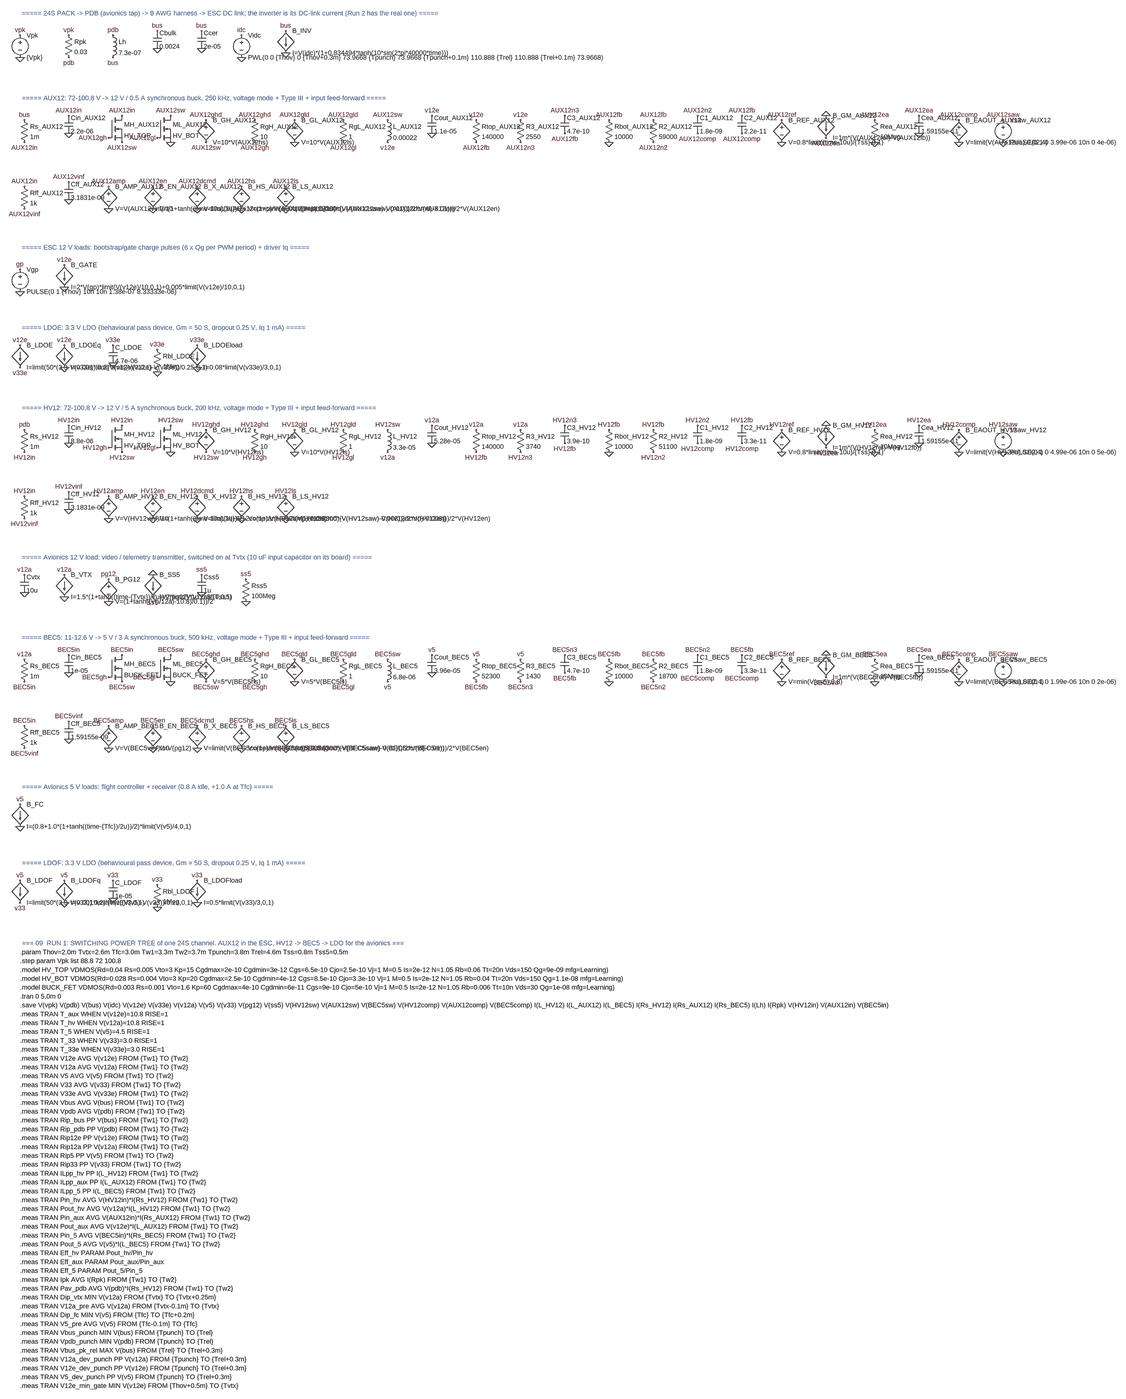
[diagram p0: schematic Rails_Switching.asc, whole sheet]
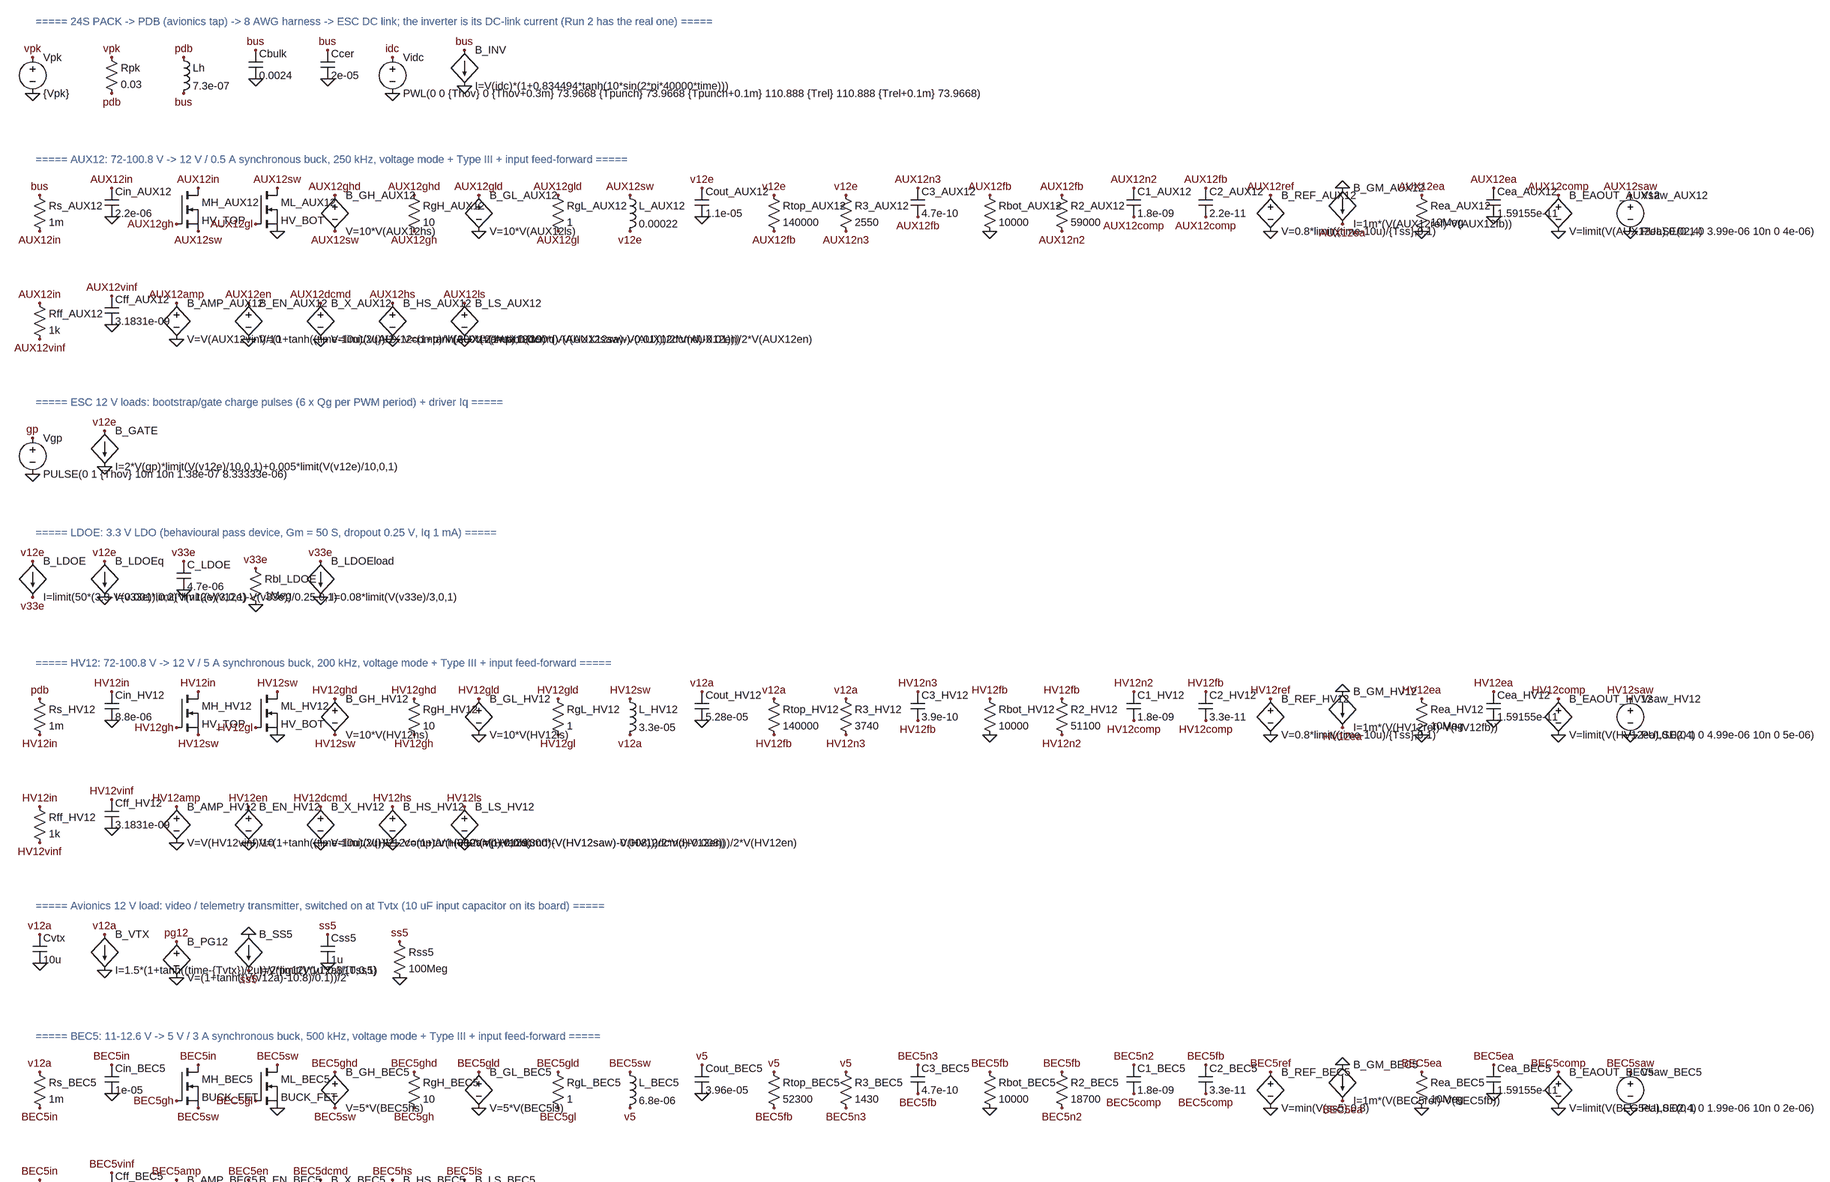
[diagram p1: schematic Rails_Switching.asc, part, row 1 of 2, column 1 of 1]
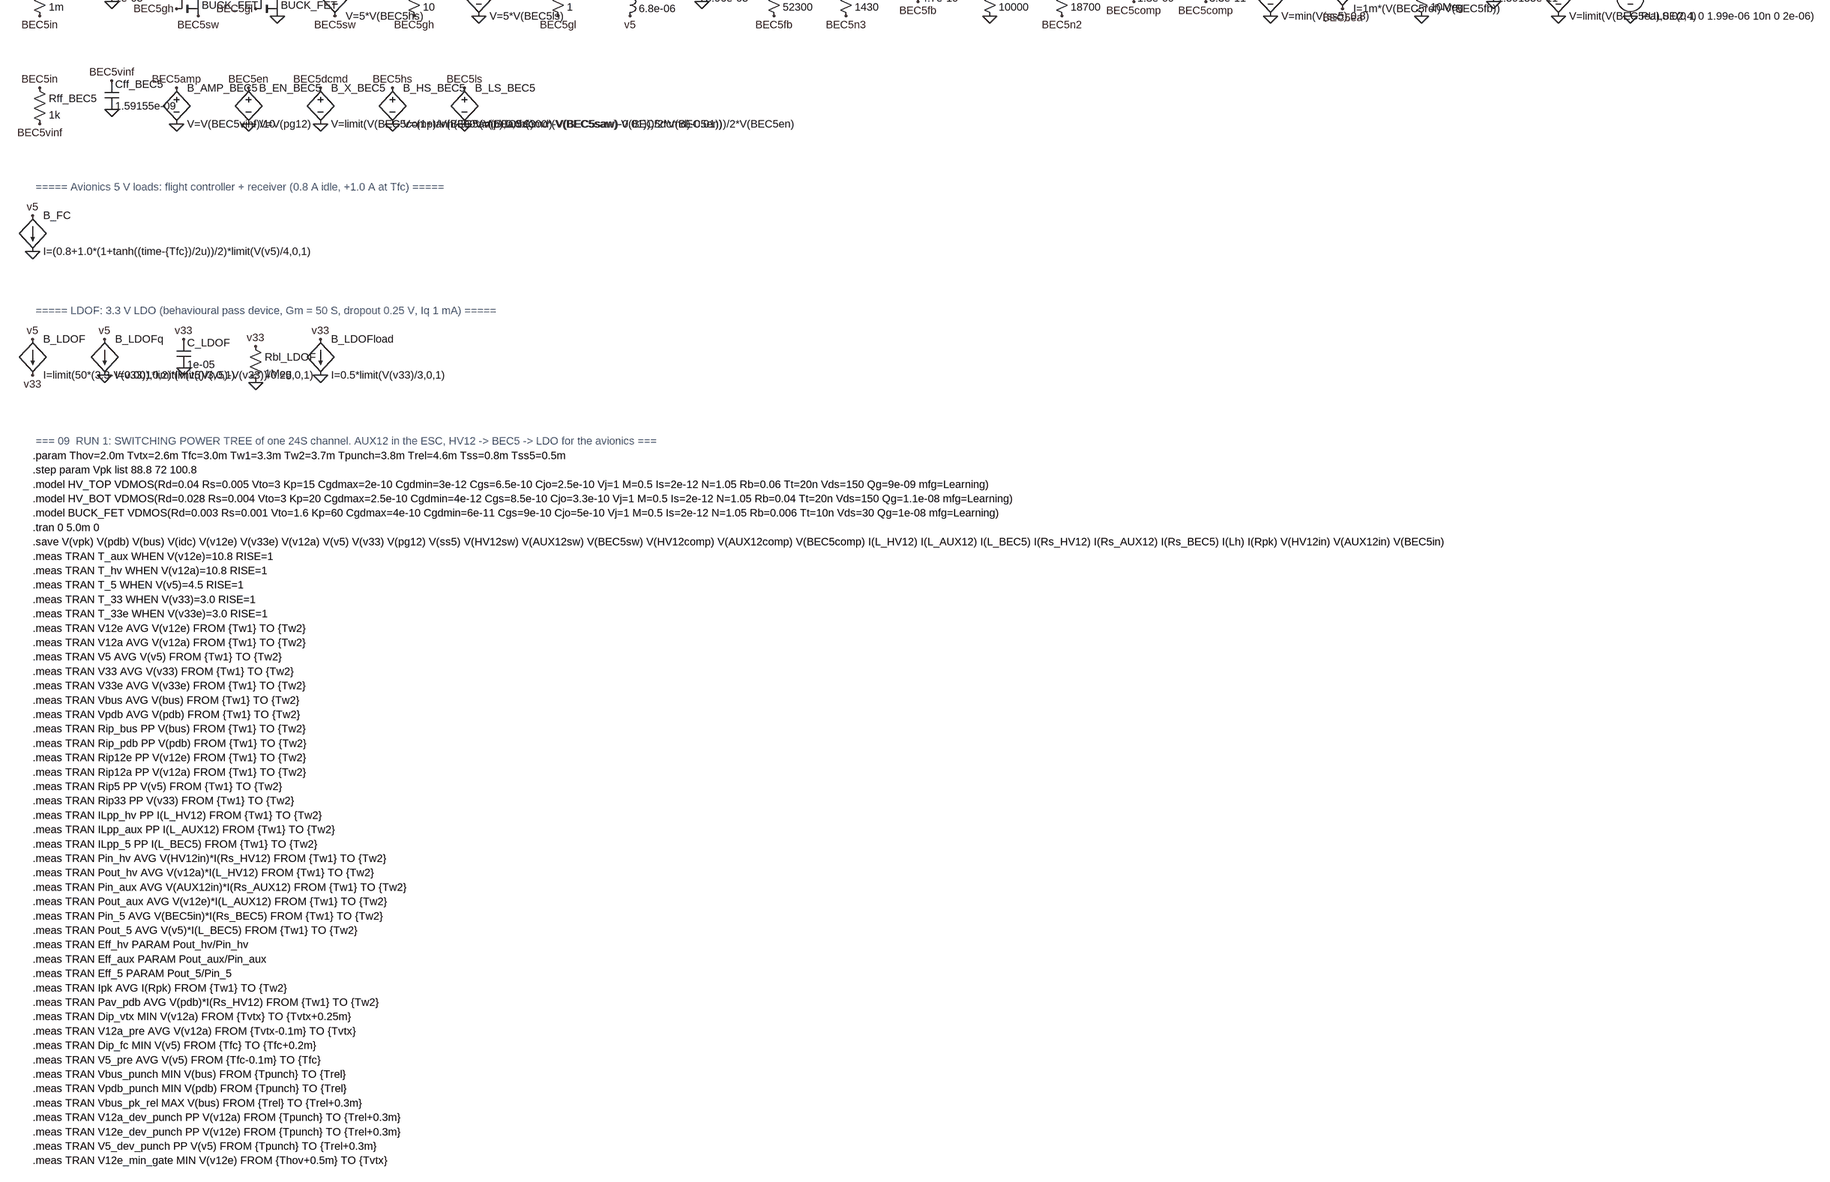
[diagram p2: schematic Rails_Switching.asc, part, row 2 of 2, column 1 of 1]
Rails_Switching.asc, the LTspice schematic file:
Version 4
SHEET 1 4000 4000
TEXT 32 96 Left 2 ; ===== 24S PACK -> PDB (avionics tap) -> 8 AWG harness -> ESC DC link; the inverter is its DC-link current (Run 2 has the real one) =====
SYMBOL voltage 32 160 R0
SYMATTR InstName Vpk
SYMATTR Value {Vpk}
FLAG 32 176 vpk
FLAG 32 256 0
SYMBOL res 192 160 R0
SYMATTR InstName Rpk
SYMATTR Value 0.03
FLAG 208 176 vpk
FLAG 208 256 pdb
SYMBOL ind 352 160 R0
SYMATTR InstName Lh
SYMATTR Value 7.3e-07
SYMATTR SpiceLine Rser=0.0041
FLAG 368 176 pdb
FLAG 368 256 bus
SYMBOL cap 512 160 R0
SYMATTR InstName Cbulk
SYMATTR Value 0.0024
SYMATTR SpiceLine Rser=0.00125
FLAG 528 160 bus
FLAG 528 224 0
SYMBOL cap 672 160 R0
SYMATTR InstName Ccer
SYMATTR Value 2e-05
SYMATTR SpiceLine Rser=1m
FLAG 688 160 bus
FLAG 688 224 0
SYMBOL voltage 832 160 R0
SYMATTR InstName Vidc
SYMATTR Value PWL(0 0 {Thov} 0 {Thov+0.3m} 73.9668 {Tpunch} 73.9668 {Tpunch+0.1m} 110.888 {Trel} 110.888 {Trel+0.1m} 73.9668)
FLAG 832 176 idc
FLAG 832 256 0
SYMBOL bi 992 160 R0
SYMATTR InstName B_INV
SYMATTR Value I=V(idc)*(1+0.834494*tanh(10*sin(2*pi*40000*time)))
FLAG 992 160 bus
FLAG 992 240 0
TEXT 32 456 Left 2 ; ===== AUX12: 72-100.8 V -> 12 V / 0.5 A synchronous buck, 250 kHz, voltage mode + Type III + input feed-forward =====
SYMBOL res 32 520 R0
SYMATTR InstName Rs_AUX12
SYMATTR Value 1m
FLAG 48 536 bus
FLAG 48 616 AUX12in
SYMBOL cap 192 520 R0
SYMATTR InstName Cin_AUX12
SYMATTR Value 2.2e-06
SYMATTR SpiceLine Rser=3m
FLAG 208 520 AUX12in
FLAG 208 584 0
SYMBOL nmos 352 520 R0
SYMATTR InstName MH_AUX12
SYMATTR Value HV_TOP
FLAG 400 520 AUX12in
FLAG 352 600 AUX12gh
FLAG 400 616 AUX12sw
SYMBOL nmos 528 520 R0
SYMATTR InstName ML_AUX12
SYMATTR Value HV_BOT
FLAG 576 520 AUX12sw
FLAG 528 600 AUX12gl
FLAG 576 616 0
SYMBOL bv 704 520 R0
SYMATTR InstName B_GH_AUX12
SYMATTR Value V=10*V(AUX12hs)
FLAG 704 536 AUX12ghd
FLAG 704 616 AUX12sw
SYMBOL res 864 520 R0
SYMATTR InstName RgH_AUX12
SYMATTR Value 10
FLAG 880 536 AUX12ghd
FLAG 880 616 AUX12gh
SYMBOL bv 1024 520 R0
SYMATTR InstName B_GL_AUX12
SYMATTR Value V=10*V(AUX12ls)
FLAG 1024 536 AUX12gld
FLAG 1024 616 0
SYMBOL res 1184 520 R0
SYMATTR InstName RgL_AUX12
SYMATTR Value 1
FLAG 1200 536 AUX12gld
FLAG 1200 616 AUX12gl
SYMBOL ind 1344 520 R0
SYMATTR InstName L_AUX12
SYMATTR Value 0.00022
SYMATTR SpiceLine Rser=0.45
FLAG 1360 536 AUX12sw
FLAG 1360 616 v12e
SYMBOL cap 1504 520 R0
SYMATTR InstName Cout_AUX12
SYMATTR Value 1.1e-05
SYMATTR SpiceLine Rser=0.0025 Lser=0.3n
FLAG 1520 520 v12e
FLAG 1520 584 0
SYMBOL res 1664 520 R0
SYMATTR InstName Rtop_AUX12
SYMATTR Value 140000
FLAG 1680 536 v12e
FLAG 1680 616 AUX12fb
SYMBOL res 1824 520 R0
SYMATTR InstName R3_AUX12
SYMATTR Value 2550
FLAG 1840 536 v12e
FLAG 1840 616 AUX12n3
SYMBOL cap 1984 520 R0
SYMATTR InstName C3_AUX12
SYMATTR Value 4.7e-10
FLAG 2000 520 AUX12n3
FLAG 2000 584 AUX12fb
SYMBOL res 2144 520 R0
SYMATTR InstName Rbot_AUX12
SYMATTR Value 10000
FLAG 2160 536 AUX12fb
FLAG 2160 616 0
SYMBOL res 2304 520 R0
SYMATTR InstName R2_AUX12
SYMATTR Value 59000
FLAG 2320 536 AUX12fb
FLAG 2320 616 AUX12n2
SYMBOL cap 2464 520 R0
SYMATTR InstName C1_AUX12
SYMATTR Value 1.8e-09
FLAG 2480 520 AUX12n2
FLAG 2480 584 AUX12comp
SYMBOL cap 2624 520 R0
SYMATTR InstName C2_AUX12
SYMATTR Value 2.2e-11
FLAG 2640 520 AUX12fb
FLAG 2640 584 AUX12comp
SYMBOL bv 2784 520 R0
SYMATTR InstName B_REF_AUX12
SYMATTR Value V=0.8*limit((time-10u)/{Tss},0,1)
FLAG 2784 536 AUX12ref
FLAG 2784 616 0
SYMBOL bi 2944 520 R0
SYMATTR InstName B_GM_AUX12
SYMATTR Value I=1m*(V(AUX12ref)-V(AUX12fb))
FLAG 2944 520 0
FLAG 2944 600 AUX12ea
SYMBOL res 3104 520 R0
SYMATTR InstName Rea_AUX12
SYMATTR Value 10Meg
FLAG 3120 536 AUX12ea
FLAG 3120 616 0
SYMBOL cap 3264 520 R0
SYMATTR InstName Cea_AUX12
SYMATTR Value 1.59155e-11
FLAG 3280 520 AUX12ea
FLAG 3280 584 0
SYMBOL bv 3424 520 R0
SYMATTR InstName B_EAOUT_AUX12
SYMATTR Value V=limit(V(AUX12ea),0.02,4)
FLAG 3424 536 AUX12comp
FLAG 3424 616 0
SYMBOL voltage 3584 520 R0
SYMATTR InstName Vsaw_AUX12
SYMATTR Value PULSE(0 1 0 3.99e-06 10n 0 4e-06)
FLAG 3584 536 AUX12saw
FLAG 3584 616 0
SYMBOL res 32 760 R0
SYMATTR InstName Rff_AUX12
SYMATTR Value 1k
FLAG 48 776 AUX12in
FLAG 48 856 AUX12vinf
SYMBOL cap 192 760 R0
SYMATTR InstName Cff_AUX12
SYMATTR Value 3.1831e-09
FLAG 208 760 AUX12vinf
FLAG 208 824 0
SYMBOL bv 352 760 R0
SYMATTR InstName B_AMP_AUX12
SYMATTR Value V=V(AUX12vinf)/10
FLAG 352 776 AUX12amp
FLAG 352 856 0
SYMBOL bv 512 760 R0
SYMATTR InstName B_EN_AUX12
SYMATTR Value V=(1+tanh((time-10u)/2u))/2
FLAG 512 776 AUX12en
FLAG 512 856 0
SYMBOL bv 672 760 R0
SYMATTR InstName B_X_AUX12
SYMATTR Value V=limit(V(AUX12comp)/V(AUX12amp),0,0.9)
FLAG 672 776 AUX12dcmd
FLAG 672 856 0
SYMBOL bv 832 760 R0
SYMATTR InstName B_HS_AUX12
SYMATTR Value V=(1+tanh(300*(V(AUX12dcmd)-V(AUX12saw)-0.01)))/2*V(AUX12en)
FLAG 832 776 AUX12hs
FLAG 832 856 0
SYMBOL bv 992 760 R0
SYMATTR InstName B_LS_AUX12
SYMATTR Value V=(1+tanh(300*(V(AUX12saw)-V(AUX12dcmd)-0.01)))/2*V(AUX12en)
FLAG 992 776 AUX12ls
FLAG 992 856 0
TEXT 32 1056 Left 2 ; ===== ESC 12 V loads: bootstrap/gate charge pulses (6 x Qg per PWM period) + driver Iq =====
SYMBOL voltage 32 1120 R0
SYMATTR InstName Vgp
SYMATTR Value PULSE(0 1 {Thov} 10n 10n 1.38e-07 8.33333e-06)
FLAG 32 1136 gp
FLAG 32 1216 0
SYMBOL bi 192 1120 R0
SYMATTR InstName B_GATE
SYMATTR Value I=2*V(gp)*limit(V(v12e)/10,0,1)+0.005*limit(V(v12e)/10,0,1)
FLAG 192 1120 v12e
FLAG 192 1200 0
TEXT 32 1416 Left 2 ; ===== LDOE: 3.3 V LDO (behavioural pass device, Gm = 50 S, dropout 0.25 V, Iq 1 mA) =====
SYMBOL bi 32 1480 R0
SYMATTR InstName B_LDOE
SYMATTR Value I=limit(50*(3.3-V(v33e)),0,2)*limit((V(v12e)-V(v33e))/0.25,0,1)
FLAG 32 1480 v12e
FLAG 32 1560 v33e
SYMBOL bi 192 1480 R0
SYMATTR InstName B_LDOEq
SYMATTR Value I=0.001*limit(V(v12e)/3,0,1)
FLAG 192 1480 v12e
FLAG 192 1560 0
SYMBOL cap 352 1480 R0
SYMATTR InstName C_LDOE
SYMATTR Value 4.7e-06
SYMATTR SpiceLine Rser=5m
FLAG 368 1480 v33e
FLAG 368 1544 0
SYMBOL res 512 1480 R0
SYMATTR InstName Rbl_LDOE
SYMATTR Value 1Meg
FLAG 528 1496 v33e
FLAG 528 1576 0
SYMBOL bi 672 1480 R0
SYMATTR InstName B_LDOEload
SYMATTR Value I=0.08*limit(V(v33e)/3,0,1)
FLAG 672 1480 v33e
FLAG 672 1560 0
TEXT 32 1776 Left 2 ; ===== HV12: 72-100.8 V -> 12 V / 5 A synchronous buck, 200 kHz, voltage mode + Type III + input feed-forward =====
SYMBOL res 32 1840 R0
SYMATTR InstName Rs_HV12
SYMATTR Value 1m
FLAG 48 1856 pdb
FLAG 48 1936 HV12in
SYMBOL cap 192 1840 R0
SYMATTR InstName Cin_HV12
SYMATTR Value 8.8e-06
SYMATTR SpiceLine Rser=3m
FLAG 208 1840 HV12in
FLAG 208 1904 0
SYMBOL nmos 352 1840 R0
SYMATTR InstName MH_HV12
SYMATTR Value HV_TOP
FLAG 400 1840 HV12in
FLAG 352 1920 HV12gh
FLAG 400 1936 HV12sw
SYMBOL nmos 528 1840 R0
SYMATTR InstName ML_HV12
SYMATTR Value HV_BOT
FLAG 576 1840 HV12sw
FLAG 528 1920 HV12gl
FLAG 576 1936 0
SYMBOL bv 704 1840 R0
SYMATTR InstName B_GH_HV12
SYMATTR Value V=10*V(HV12hs)
FLAG 704 1856 HV12ghd
FLAG 704 1936 HV12sw
SYMBOL res 864 1840 R0
SYMATTR InstName RgH_HV12
SYMATTR Value 10
FLAG 880 1856 HV12ghd
FLAG 880 1936 HV12gh
SYMBOL bv 1024 1840 R0
SYMATTR InstName B_GL_HV12
SYMATTR Value V=10*V(HV12ls)
FLAG 1024 1856 HV12gld
FLAG 1024 1936 0
SYMBOL res 1184 1840 R0
SYMATTR InstName RgL_HV12
SYMATTR Value 1
FLAG 1200 1856 HV12gld
FLAG 1200 1936 HV12gl
SYMBOL ind 1344 1840 R0
SYMATTR InstName L_HV12
SYMATTR Value 3.3e-05
SYMATTR SpiceLine Rser=0.015
FLAG 1360 1856 HV12sw
FLAG 1360 1936 v12a
SYMBOL cap 1504 1840 R0
SYMATTR InstName Cout_HV12
SYMATTR Value 5.28e-05
SYMATTR SpiceLine Rser=0.00125 Lser=0.3n
FLAG 1520 1840 v12a
FLAG 1520 1904 0
SYMBOL res 1664 1840 R0
SYMATTR InstName Rtop_HV12
SYMATTR Value 140000
FLAG 1680 1856 v12a
FLAG 1680 1936 HV12fb
SYMBOL res 1824 1840 R0
SYMATTR InstName R3_HV12
SYMATTR Value 3740
FLAG 1840 1856 v12a
FLAG 1840 1936 HV12n3
SYMBOL cap 1984 1840 R0
SYMATTR InstName C3_HV12
SYMATTR Value 3.9e-10
FLAG 2000 1840 HV12n3
FLAG 2000 1904 HV12fb
SYMBOL res 2144 1840 R0
SYMATTR InstName Rbot_HV12
SYMATTR Value 10000
FLAG 2160 1856 HV12fb
FLAG 2160 1936 0
SYMBOL res 2304 1840 R0
SYMATTR InstName R2_HV12
SYMATTR Value 51100
FLAG 2320 1856 HV12fb
FLAG 2320 1936 HV12n2
SYMBOL cap 2464 1840 R0
SYMATTR InstName C1_HV12
SYMATTR Value 1.8e-09
FLAG 2480 1840 HV12n2
FLAG 2480 1904 HV12comp
SYMBOL cap 2624 1840 R0
SYMATTR InstName C2_HV12
SYMATTR Value 3.3e-11
FLAG 2640 1840 HV12fb
FLAG 2640 1904 HV12comp
SYMBOL bv 2784 1840 R0
SYMATTR InstName B_REF_HV12
SYMATTR Value V=0.8*limit((time-10u)/{Tss},0,1)
FLAG 2784 1856 HV12ref
FLAG 2784 1936 0
SYMBOL bi 2944 1840 R0
SYMATTR InstName B_GM_HV12
SYMATTR Value I=1m*(V(HV12ref)-V(HV12fb))
FLAG 2944 1840 0
FLAG 2944 1920 HV12ea
SYMBOL res 3104 1840 R0
SYMATTR InstName Rea_HV12
SYMATTR Value 10Meg
FLAG 3120 1856 HV12ea
FLAG 3120 1936 0
SYMBOL cap 3264 1840 R0
SYMATTR InstName Cea_HV12
SYMATTR Value 1.59155e-11
FLAG 3280 1840 HV12ea
FLAG 3280 1904 0
SYMBOL bv 3424 1840 R0
SYMATTR InstName B_EAOUT_HV12
SYMATTR Value V=limit(V(HV12ea),0.02,4)
FLAG 3424 1856 HV12comp
FLAG 3424 1936 0
SYMBOL voltage 3584 1840 R0
SYMATTR InstName Vsaw_HV12
SYMATTR Value PULSE(0 1 0 4.99e-06 10n 0 5e-06)
FLAG 3584 1856 HV12saw
FLAG 3584 1936 0
SYMBOL res 32 2080 R0
SYMATTR InstName Rff_HV12
SYMATTR Value 1k
FLAG 48 2096 HV12in
FLAG 48 2176 HV12vinf
SYMBOL cap 192 2080 R0
SYMATTR InstName Cff_HV12
SYMATTR Value 3.1831e-09
FLAG 208 2080 HV12vinf
FLAG 208 2144 0
SYMBOL bv 352 2080 R0
SYMATTR InstName B_AMP_HV12
SYMATTR Value V=V(HV12vinf)/10
FLAG 352 2096 HV12amp
FLAG 352 2176 0
SYMBOL bv 512 2080 R0
SYMATTR InstName B_EN_HV12
SYMATTR Value V=(1+tanh((time-10u)/2u))/2
FLAG 512 2096 HV12en
FLAG 512 2176 0
SYMBOL bv 672 2080 R0
SYMATTR InstName B_X_HV12
SYMATTR Value V=limit(V(HV12comp)/V(HV12amp),0,0.9)
FLAG 672 2096 HV12dcmd
FLAG 672 2176 0
SYMBOL bv 832 2080 R0
SYMATTR InstName B_HS_HV12
SYMATTR Value V=(1+tanh(300*(V(HV12dcmd)-V(HV12saw)-0.008)))/2*V(HV12en)
FLAG 832 2096 HV12hs
FLAG 832 2176 0
SYMBOL bv 992 2080 R0
SYMATTR InstName B_LS_HV12
SYMATTR Value V=(1+tanh(300*(V(HV12saw)-V(HV12dcmd)-0.008)))/2*V(HV12en)
FLAG 992 2096 HV12ls
FLAG 992 2176 0
TEXT 32 2376 Left 2 ; ===== Avionics 12 V load: video / telemetry transmitter, switched on at Tvtx (10 uF input capacitor on its board) =====
SYMBOL cap 32 2440 R0
SYMATTR InstName Cvtx
SYMATTR Value 10u
SYMATTR SpiceLine Rser=10m
FLAG 48 2440 v12a
FLAG 48 2504 0
SYMBOL bi 192 2440 R0
SYMATTR InstName B_VTX
SYMATTR Value I=1.5*(1+tanh((time-{Tvtx})/2u))/2*limit(V(v12a)/10,0,1)
FLAG 192 2440 v12a
FLAG 192 2520 0
SYMBOL bv 352 2440 R0
SYMATTR InstName B_PG12
SYMATTR Value V=(1+tanh((V(v12a)-10.8)/0.1))/2
FLAG 352 2456 pg12
FLAG 352 2536 0
SYMBOL bi 512 2440 R0
SYMATTR InstName B_SS5
SYMATTR Value I=V(pg12)*1u*0.8/{Tss5}
FLAG 512 2440 0
FLAG 512 2520 ss5
SYMBOL cap 672 2440 R0
SYMATTR InstName Css5
SYMATTR Value 1u
FLAG 688 2440 ss5
FLAG 688 2504 0
SYMBOL res 832 2440 R0
SYMATTR InstName Rss5
SYMATTR Value 100Meg
FLAG 848 2456 ss5
FLAG 848 2536 0
TEXT 32 2736 Left 2 ; ===== BEC5: 11-12.6 V -> 5 V / 3 A synchronous buck, 500 kHz, voltage mode + Type III + input feed-forward =====
SYMBOL res 32 2800 R0
SYMATTR InstName Rs_BEC5
SYMATTR Value 1m
FLAG 48 2816 v12a
FLAG 48 2896 BEC5in
SYMBOL cap 192 2800 R0
SYMATTR InstName Cin_BEC5
SYMATTR Value 1e-05
SYMATTR SpiceLine Rser=3m
FLAG 208 2800 BEC5in
FLAG 208 2864 0
SYMBOL nmos 352 2800 R0
SYMATTR InstName MH_BEC5
SYMATTR Value BUCK_FET
FLAG 400 2800 BEC5in
FLAG 352 2880 BEC5gh
FLAG 400 2896 BEC5sw
SYMBOL nmos 528 2800 R0
SYMATTR InstName ML_BEC5
SYMATTR Value BUCK_FET
FLAG 576 2800 BEC5sw
FLAG 528 2880 BEC5gl
FLAG 576 2896 0
SYMBOL bv 704 2800 R0
SYMATTR InstName B_GH_BEC5
SYMATTR Value V=5*V(BEC5hs)
FLAG 704 2816 BEC5ghd
FLAG 704 2896 BEC5sw
SYMBOL res 864 2800 R0
SYMATTR InstName RgH_BEC5
SYMATTR Value 10
FLAG 880 2816 BEC5ghd
FLAG 880 2896 BEC5gh
SYMBOL bv 1024 2800 R0
SYMATTR InstName B_GL_BEC5
SYMATTR Value V=5*V(BEC5ls)
FLAG 1024 2816 BEC5gld
FLAG 1024 2896 0
SYMBOL res 1184 2800 R0
SYMATTR InstName RgL_BEC5
SYMATTR Value 1
FLAG 1200 2816 BEC5gld
FLAG 1200 2896 BEC5gl
SYMBOL ind 1344 2800 R0
SYMATTR InstName L_BEC5
SYMATTR Value 6.8e-06
SYMATTR SpiceLine Rser=0.015
FLAG 1360 2816 BEC5sw
FLAG 1360 2896 v5
SYMBOL cap 1504 2800 R0
SYMATTR InstName Cout_BEC5
SYMATTR Value 3.96e-05
SYMATTR SpiceLine Rser=0.00166667 Lser=0.3n
FLAG 1520 2800 v5
FLAG 1520 2864 0
SYMBOL res 1664 2800 R0
SYMATTR InstName Rtop_BEC5
SYMATTR Value 52300
FLAG 1680 2816 v5
FLAG 1680 2896 BEC5fb
SYMBOL res 1824 2800 R0
SYMATTR InstName R3_BEC5
SYMATTR Value 1430
FLAG 1840 2816 v5
FLAG 1840 2896 BEC5n3
SYMBOL cap 1984 2800 R0
SYMATTR InstName C3_BEC5
SYMATTR Value 4.7e-10
FLAG 2000 2800 BEC5n3
FLAG 2000 2864 BEC5fb
SYMBOL res 2144 2800 R0
SYMATTR InstName Rbot_BEC5
SYMATTR Value 10000
FLAG 2160 2816 BEC5fb
FLAG 2160 2896 0
SYMBOL res 2304 2800 R0
SYMATTR InstName R2_BEC5
SYMATTR Value 18700
FLAG 2320 2816 BEC5fb
FLAG 2320 2896 BEC5n2
SYMBOL cap 2464 2800 R0
SYMATTR InstName C1_BEC5
SYMATTR Value 1.8e-09
FLAG 2480 2800 BEC5n2
FLAG 2480 2864 BEC5comp
SYMBOL cap 2624 2800 R0
SYMATTR InstName C2_BEC5
SYMATTR Value 3.3e-11
FLAG 2640 2800 BEC5fb
FLAG 2640 2864 BEC5comp
SYMBOL bv 2784 2800 R0
SYMATTR InstName B_REF_BEC5
SYMATTR Value V=min(V(ss5),0.8)
FLAG 2784 2816 BEC5ref
FLAG 2784 2896 0
SYMBOL bi 2944 2800 R0
SYMATTR InstName B_GM_BEC5
SYMATTR Value I=1m*(V(BEC5ref)-V(BEC5fb))
FLAG 2944 2800 0
FLAG 2944 2880 BEC5ea
SYMBOL res 3104 2800 R0
SYMATTR InstName Rea_BEC5
SYMATTR Value 10Meg
FLAG 3120 2816 BEC5ea
FLAG 3120 2896 0
SYMBOL cap 3264 2800 R0
SYMATTR InstName Cea_BEC5
SYMATTR Value 1.59155e-11
FLAG 3280 2800 BEC5ea
FLAG 3280 2864 0
SYMBOL bv 3424 2800 R0
SYMATTR InstName B_EAOUT_BEC5
SYMATTR Value V=limit(V(BEC5ea),0.02,4)
FLAG 3424 2816 BEC5comp
FLAG 3424 2896 0
SYMBOL voltage 3584 2800 R0
SYMATTR InstName Vsaw_BEC5
SYMATTR Value PULSE(0 1 0 1.99e-06 10n 0 2e-06)
FLAG 3584 2816 BEC5saw
FLAG 3584 2896 0
SYMBOL res 32 3040 R0
SYMATTR InstName Rff_BEC5
SYMATTR Value 1k
FLAG 48 3056 BEC5in
FLAG 48 3136 BEC5vinf
SYMBOL cap 192 3040 R0
SYMATTR InstName Cff_BEC5
SYMATTR Value 1.59155e-09
FLAG 208 3040 BEC5vinf
FLAG 208 3104 0
SYMBOL bv 352 3040 R0
SYMATTR InstName B_AMP_BEC5
SYMATTR Value V=V(BEC5vinf)/10
FLAG 352 3056 BEC5amp
FLAG 352 3136 0
SYMBOL bv 512 3040 R0
SYMATTR InstName B_EN_BEC5
SYMATTR Value V=V(pg12)
FLAG 512 3056 BEC5en
FLAG 512 3136 0
SYMBOL bv 672 3040 R0
SYMATTR InstName B_X_BEC5
SYMATTR Value V=limit(V(BEC5comp)/V(BEC5amp),0,0.9)
FLAG 672 3056 BEC5dcmd
FLAG 672 3136 0
SYMBOL bv 832 3040 R0
SYMATTR InstName B_HS_BEC5
SYMATTR Value V=(1+tanh(300*(V(BEC5dcmd)-V(BEC5saw)-0.01)))/2*V(BEC5en)
FLAG 832 3056 BEC5hs
FLAG 832 3136 0
SYMBOL bv 992 3040 R0
SYMATTR InstName B_LS_BEC5
SYMATTR Value V=(1+tanh(300*(V(BEC5saw)-V(BEC5dcmd)-0.01)))/2*V(BEC5en)
FLAG 992 3056 BEC5ls
FLAG 992 3136 0
TEXT 32 3336 Left 2 ; ===== Avionics 5 V loads: flight controller + receiver (0.8 A idle, +1.0 A at Tfc) =====
SYMBOL bi 32 3400 R0
SYMATTR InstName B_FC
SYMATTR Value I=(0.8+1.0*(1+tanh((time-{Tfc})/2u))/2)*limit(V(v5)/4,0,1)
FLAG 32 3400 v5
FLAG 32 3480 0
TEXT 32 3696 Left 2 ; ===== LDOF: 3.3 V LDO (behavioural pass device, Gm = 50 S, dropout 0.25 V, Iq 1 mA) =====
SYMBOL bi 32 3760 R0
SYMATTR InstName B_LDOF
SYMATTR Value I=limit(50*(3.3-V(v33)),0,2)*limit((V(v5)-V(v33))/0.25,0,1)
FLAG 32 3760 v5
FLAG 32 3840 v33
SYMBOL bi 192 3760 R0
SYMATTR InstName B_LDOFq
SYMATTR Value I=0.001*limit(V(v5)/3,0,1)
FLAG 192 3760 v5
FLAG 192 3840 0
SYMBOL cap 352 3760 R0
SYMATTR InstName C_LDOF
SYMATTR Value 1e-05
SYMATTR SpiceLine Rser=5m
FLAG 368 3760 v33
FLAG 368 3824 0
SYMBOL res 512 3760 R0
SYMATTR InstName Rbl_LDOF
SYMATTR Value 1Meg
FLAG 528 3776 v33
FLAG 528 3856 0
SYMBOL bi 672 3760 R0
SYMATTR InstName B_LDOFload
SYMATTR Value I=0.5*limit(V(v33)/3,0,1)
FLAG 672 3760 v33
FLAG 672 3840 0
TEXT 32 4200 Left 2 ; === 09  RUN 1: SWITCHING POWER TREE of one 24S channel. AUX12 in the ESC, HV12 -> BEC5 -> LDO for the avionics ===
TEXT 32 4232 Left 2 !.param Thov=2.0m Tvtx=2.6m Tfc=3.0m Tw1=3.3m Tw2=3.7m Tpunch=3.8m Trel=4.6m Tss=0.8m Tss5=0.5m
TEXT 32 4264 Left 2 !.step param Vpk list 88.8 72 100.8
TEXT 32 4296 Left 2 !.model HV_TOP VDMOS(Rd=0.04 Rs=0.005 Vto=3 Kp=15 Cgdmax=2e-10 Cgdmin=3e-12 Cgs=6.5e-10 Cjo=2.5e-10 Vj=1 M=0.5 Is=2e-12 N=1.05 Rb=0.06 Tt=20n Vds=150 Qg=9e-09 mfg=Learning)
TEXT 32 4328 Left 2 !.model HV_BOT VDMOS(Rd=0.028 Rs=0.004 Vto=3 Kp=20 Cgdmax=2.5e-10 Cgdmin=4e-12 Cgs=8.5e-10 Cjo=3.3e-10 Vj=1 M=0.5 Is=2e-12 N=1.05 Rb=0.04 Tt=20n Vds=150 Qg=1.1e-08 mfg=Learning)
TEXT 32 4360 Left 2 !.model BUCK_FET VDMOS(Rd=0.003 Rs=0.001 Vto=1.6 Kp=60 Cgdmax=4e-10 Cgdmin=6e-11 Cgs=9e-10 Cjo=5e-10 Vj=1 M=0.5 Is=2e-12 N=1.05 Rb=0.006 Tt=10n Vds=30 Qg=1e-08 mfg=Learning)
TEXT 32 4392 Left 2 !.tran 0 5.0m 0
TEXT 32 4424 Left 2 !.save V(vpk) V(pdb) V(bus) V(idc) V(v12e) V(v33e) V(v12a) V(v5) V(v33) V(pg12) V(ss5) V(HV12sw) V(AUX12sw) V(BEC5sw) V(HV12comp) V(AUX12comp) V(BEC5comp) I(L_HV12) I(L_AUX12) I(L_BEC5) I(Rs_HV12) I(Rs_AUX12) I(Rs_BEC5) I(Lh) I(Rpk) V(HV12in) V(AUX12in) V(BEC5in)
TEXT 32 4456 Left 2 !.meas TRAN T_aux WHEN V(v12e)=10.8 RISE=1
TEXT 32 4488 Left 2 !.meas TRAN T_hv WHEN V(v12a)=10.8 RISE=1
TEXT 32 4520 Left 2 !.meas TRAN T_5 WHEN V(v5)=4.5 RISE=1
TEXT 32 4552 Left 2 !.meas TRAN T_33 WHEN V(v33)=3.0 RISE=1
TEXT 32 4584 Left 2 !.meas TRAN T_33e WHEN V(v33e)=3.0 RISE=1
TEXT 32 4616 Left 2 !.meas TRAN V12e AVG V(v12e) FROM {Tw1} TO {Tw2}
TEXT 32 4648 Left 2 !.meas TRAN V12a AVG V(v12a) FROM {Tw1} TO {Tw2}
TEXT 32 4680 Left 2 !.meas TRAN V5 AVG V(v5) FROM {Tw1} TO {Tw2}
TEXT 32 4712 Left 2 !.meas TRAN V33 AVG V(v33) FROM {Tw1} TO {Tw2}
TEXT 32 4744 Left 2 !.meas TRAN V33e AVG V(v33e) FROM {Tw1} TO {Tw2}
TEXT 32 4776 Left 2 !.meas TRAN Vbus AVG V(bus) FROM {Tw1} TO {Tw2}
TEXT 32 4808 Left 2 !.meas TRAN Vpdb AVG V(pdb) FROM {Tw1} TO {Tw2}
TEXT 32 4840 Left 2 !.meas TRAN Rip_bus PP V(bus) FROM {Tw1} TO {Tw2}
TEXT 32 4872 Left 2 !.meas TRAN Rip_pdb PP V(pdb) FROM {Tw1} TO {Tw2}
TEXT 32 4904 Left 2 !.meas TRAN Rip12e PP V(v12e) FROM {Tw1} TO {Tw2}
TEXT 32 4936 Left 2 !.meas TRAN Rip12a PP V(v12a) FROM {Tw1} TO {Tw2}
TEXT 32 4968 Left 2 !.meas TRAN Rip5 PP V(v5) FROM {Tw1} TO {Tw2}
TEXT 32 5000 Left 2 !.meas TRAN Rip33 PP V(v33) FROM {Tw1} TO {Tw2}
TEXT 32 5032 Left 2 !.meas TRAN ILpp_hv PP I(L_HV12) FROM {Tw1} TO {Tw2}
TEXT 32 5064 Left 2 !.meas TRAN ILpp_aux PP I(L_AUX12) FROM {Tw1} TO {Tw2}
TEXT 32 5096 Left 2 !.meas TRAN ILpp_5 PP I(L_BEC5) FROM {Tw1} TO {Tw2}
TEXT 32 5128 Left 2 !.meas TRAN Pin_hv AVG V(HV12in)*I(Rs_HV12) FROM {Tw1} TO {Tw2}
TEXT 32 5160 Left 2 !.meas TRAN Pout_hv AVG V(v12a)*I(L_HV12) FROM {Tw1} TO {Tw2}
TEXT 32 5192 Left 2 !.meas TRAN Pin_aux AVG V(AUX12in)*I(Rs_AUX12) FROM {Tw1} TO {Tw2}
TEXT 32 5224 Left 2 !.meas TRAN Pout_aux AVG V(v12e)*I(L_AUX12) FROM {Tw1} TO {Tw2}
TEXT 32 5256 Left 2 !.meas TRAN Pin_5 AVG V(BEC5in)*I(Rs_BEC5) FROM {Tw1} TO {Tw2}
TEXT 32 5288 Left 2 !.meas TRAN Pout_5 AVG V(v5)*I(L_BEC5) FROM {Tw1} TO {Tw2}
TEXT 32 5320 Left 2 !.meas TRAN Eff_hv PARAM Pout_hv/Pin_hv
TEXT 32 5352 Left 2 !.meas TRAN Eff_aux PARAM Pout_aux/Pin_aux
TEXT 32 5384 Left 2 !.meas TRAN Eff_5 PARAM Pout_5/Pin_5
TEXT 32 5416 Left 2 !.meas TRAN Ipk AVG I(Rpk) FROM {Tw1} TO {Tw2}
TEXT 32 5448 Left 2 !.meas TRAN Pav_pdb AVG V(pdb)*I(Rs_HV12) FROM {Tw1} TO {Tw2}
TEXT 32 5480 Left 2 !.meas TRAN Dip_vtx MIN V(v12a) FROM {Tvtx} TO {Tvtx+0.25m}
TEXT 32 5512 Left 2 !.meas TRAN V12a_pre AVG V(v12a) FROM {Tvtx-0.1m} TO {Tvtx}
TEXT 32 5544 Left 2 !.meas TRAN Dip_fc MIN V(v5) FROM {Tfc} TO {Tfc+0.2m}
TEXT 32 5576 Left 2 !.meas TRAN V5_pre AVG V(v5) FROM {Tfc-0.1m} TO {Tfc}
TEXT 32 5608 Left 2 !.meas TRAN Vbus_punch MIN V(bus) FROM {Tpunch} TO {Trel}
TEXT 32 5640 Left 2 !.meas TRAN Vpdb_punch MIN V(pdb) FROM {Tpunch} TO {Trel}
TEXT 32 5672 Left 2 !.meas TRAN Vbus_pk_rel MAX V(bus) FROM {Trel} TO {Trel+0.3m}
TEXT 32 5704 Left 2 !.meas TRAN V12a_dev_punch PP V(v12a) FROM {Tpunch} TO {Trel+0.3m}
TEXT 32 5736 Left 2 !.meas TRAN V12e_dev_punch PP V(v12e) FROM {Tpunch} TO {Trel+0.3m}
TEXT 32 5768 Left 2 !.meas TRAN V5_dev_punch PP V(v5) FROM {Tpunch} TO {Trel+0.3m}
TEXT 32 5800 Left 2 !.meas TRAN V12e_min_gate MIN V(v12e) FROM {Thov+0.5m} TO {Tvtx}

The netlist it stands for:
* Rails_Switching.asc
Vpk vpk 0 {Vpk}
Rpk vpk pdb 0.03
Lh pdb bus 7.3e-07 Rser=0.0041
Cbulk bus 0 0.0024 Rser=0.00125
Ccer bus 0 2e-05 Rser=1m
Vidc idc 0 PWL(0 0 {Thov} 0 {Thov+0.3m} 73.9668 {Tpunch} 73.9668 {Tpunch+0.1m} 110.888 {Trel} 110.888 {Trel+0.1m} 73.9668)
B_INV bus 0 I=V(idc)*(1+0.834494*tanh(10*sin(2*pi*40000*time)))
Rs_AUX12 bus AUX12in 1m
Cin_AUX12 AUX12in 0 2.2e-06 Rser=3m
MH_AUX12 AUX12in AUX12gh AUX12sw AUX12sw HV_TOP
ML_AUX12 AUX12sw AUX12gl 0 0 HV_BOT
B_GH_AUX12 AUX12ghd AUX12sw V=10*V(AUX12hs)
RgH_AUX12 AUX12ghd AUX12gh 10
B_GL_AUX12 AUX12gld 0 V=10*V(AUX12ls)
RgL_AUX12 AUX12gld AUX12gl 1
L_AUX12 AUX12sw v12e 0.00022 Rser=0.45
Cout_AUX12 v12e 0 1.1e-05 Rser=0.0025 Lser=0.3n
Rtop_AUX12 v12e AUX12fb 140000
R3_AUX12 v12e AUX12n3 2550
C3_AUX12 AUX12n3 AUX12fb 4.7e-10
Rbot_AUX12 AUX12fb 0 10000
R2_AUX12 AUX12fb AUX12n2 59000
C1_AUX12 AUX12n2 AUX12comp 1.8e-09
C2_AUX12 AUX12fb AUX12comp 2.2e-11
B_REF_AUX12 AUX12ref 0 V=0.8*limit((time-10u)/{Tss},0,1)
B_GM_AUX12 0 AUX12ea I=1m*(V(AUX12ref)-V(AUX12fb))
Rea_AUX12 AUX12ea 0 10Meg
Cea_AUX12 AUX12ea 0 1.59155e-11
B_EAOUT_AUX12 AUX12comp 0 V=limit(V(AUX12ea),0.02,4)
Vsaw_AUX12 AUX12saw 0 PULSE(0 1 0 3.99e-06 10n 0 4e-06)
Rff_AUX12 AUX12in AUX12vinf 1k
Cff_AUX12 AUX12vinf 0 3.1831e-09
B_AMP_AUX12 AUX12amp 0 V=V(AUX12vinf)/10
B_EN_AUX12 AUX12en 0 V=(1+tanh((time-10u)/2u))/2
B_X_AUX12 AUX12dcmd 0 V=limit(V(AUX12comp)/V(AUX12amp),0,0.9)
B_HS_AUX12 AUX12hs 0 V=(1+tanh(300*(V(AUX12dcmd)-V(AUX12saw)-0.01)))/2*V(AUX12en)
B_LS_AUX12 AUX12ls 0 V=(1+tanh(300*(V(AUX12saw)-V(AUX12dcmd)-0.01)))/2*V(AUX12en)
Vgp gp 0 PULSE(0 1 {Thov} 10n 10n 1.38e-07 8.33333e-06)
B_GATE v12e 0 I=2*V(gp)*limit(V(v12e)/10,0,1)+0.005*limit(V(v12e)/10,0,1)
B_LDOE v12e v33e I=limit(50*(3.3-V(v33e)),0,2)*limit((V(v12e)-V(v33e))/0.25,0,1)
B_LDOEq v12e 0 I=0.001*limit(V(v12e)/3,0,1)
C_LDOE v33e 0 4.7e-06 Rser=5m
Rbl_LDOE v33e 0 1Meg
B_LDOEload v33e 0 I=0.08*limit(V(v33e)/3,0,1)
Rs_HV12 pdb HV12in 1m
Cin_HV12 HV12in 0 8.8e-06 Rser=3m
MH_HV12 HV12in HV12gh HV12sw HV12sw HV_TOP
ML_HV12 HV12sw HV12gl 0 0 HV_BOT
B_GH_HV12 HV12ghd HV12sw V=10*V(HV12hs)
RgH_HV12 HV12ghd HV12gh 10
B_GL_HV12 HV12gld 0 V=10*V(HV12ls)
RgL_HV12 HV12gld HV12gl 1
L_HV12 HV12sw v12a 3.3e-05 Rser=0.015
Cout_HV12 v12a 0 5.28e-05 Rser=0.00125 Lser=0.3n
Rtop_HV12 v12a HV12fb 140000
R3_HV12 v12a HV12n3 3740
C3_HV12 HV12n3 HV12fb 3.9e-10
Rbot_HV12 HV12fb 0 10000
R2_HV12 HV12fb HV12n2 51100
C1_HV12 HV12n2 HV12comp 1.8e-09
C2_HV12 HV12fb HV12comp 3.3e-11
B_REF_HV12 HV12ref 0 V=0.8*limit((time-10u)/{Tss},0,1)
B_GM_HV12 0 HV12ea I=1m*(V(HV12ref)-V(HV12fb))
Rea_HV12 HV12ea 0 10Meg
Cea_HV12 HV12ea 0 1.59155e-11
B_EAOUT_HV12 HV12comp 0 V=limit(V(HV12ea),0.02,4)
Vsaw_HV12 HV12saw 0 PULSE(0 1 0 4.99e-06 10n 0 5e-06)
Rff_HV12 HV12in HV12vinf 1k
Cff_HV12 HV12vinf 0 3.1831e-09
B_AMP_HV12 HV12amp 0 V=V(HV12vinf)/10
B_EN_HV12 HV12en 0 V=(1+tanh((time-10u)/2u))/2
B_X_HV12 HV12dcmd 0 V=limit(V(HV12comp)/V(HV12amp),0,0.9)
B_HS_HV12 HV12hs 0 V=(1+tanh(300*(V(HV12dcmd)-V(HV12saw)-0.008)))/2*V(HV12en)
B_LS_HV12 HV12ls 0 V=(1+tanh(300*(V(HV12saw)-V(HV12dcmd)-0.008)))/2*V(HV12en)
Cvtx v12a 0 10u Rser=10m
B_VTX v12a 0 I=1.5*(1+tanh((time-{Tvtx})/2u))/2*limit(V(v12a)/10,0,1)
B_PG12 pg12 0 V=(1+tanh((V(v12a)-10.8)/0.1))/2
B_SS5 0 ss5 I=V(pg12)*1u*0.8/{Tss5}
Css5 ss5 0 1u
Rss5 ss5 0 100Meg
Rs_BEC5 v12a BEC5in 1m
Cin_BEC5 BEC5in 0 1e-05 Rser=3m
MH_BEC5 BEC5in BEC5gh BEC5sw BEC5sw BUCK_FET
ML_BEC5 BEC5sw BEC5gl 0 0 BUCK_FET
B_GH_BEC5 BEC5ghd BEC5sw V=5*V(BEC5hs)
RgH_BEC5 BEC5ghd BEC5gh 10
B_GL_BEC5 BEC5gld 0 V=5*V(BEC5ls)
RgL_BEC5 BEC5gld BEC5gl 1
L_BEC5 BEC5sw v5 6.8e-06 Rser=0.015
Cout_BEC5 v5 0 3.96e-05 Rser=0.00166667 Lser=0.3n
Rtop_BEC5 v5 BEC5fb 52300
R3_BEC5 v5 BEC5n3 1430
C3_BEC5 BEC5n3 BEC5fb 4.7e-10
Rbot_BEC5 BEC5fb 0 10000
R2_BEC5 BEC5fb BEC5n2 18700
C1_BEC5 BEC5n2 BEC5comp 1.8e-09
C2_BEC5 BEC5fb BEC5comp 3.3e-11
B_REF_BEC5 BEC5ref 0 V=min(V(ss5),0.8)
B_GM_BEC5 0 BEC5ea I=1m*(V(BEC5ref)-V(BEC5fb))
Rea_BEC5 BEC5ea 0 10Meg
Cea_BEC5 BEC5ea 0 1.59155e-11
B_EAOUT_BEC5 BEC5comp 0 V=limit(V(BEC5ea),0.02,4)
Vsaw_BEC5 BEC5saw 0 PULSE(0 1 0 1.99e-06 10n 0 2e-06)
Rff_BEC5 BEC5in BEC5vinf 1k
Cff_BEC5 BEC5vinf 0 1.59155e-09
B_AMP_BEC5 BEC5amp 0 V=V(BEC5vinf)/10
B_EN_BEC5 BEC5en 0 V=V(pg12)
B_X_BEC5 BEC5dcmd 0 V=limit(V(BEC5comp)/V(BEC5amp),0,0.9)
B_HS_BEC5 BEC5hs 0 V=(1+tanh(300*(V(BEC5dcmd)-V(BEC5saw)-0.01)))/2*V(BEC5en)
B_LS_BEC5 BEC5ls 0 V=(1+tanh(300*(V(BEC5saw)-V(BEC5dcmd)-0.01)))/2*V(BEC5en)
B_FC v5 0 I=(0.8+1.0*(1+tanh((time-{Tfc})/2u))/2)*limit(V(v5)/4,0,1)
B_LDOF v5 v33 I=limit(50*(3.3-V(v33)),0,2)*limit((V(v5)-V(v33))/0.25,0,1)
B_LDOFq v5 0 I=0.001*limit(V(v5)/3,0,1)
C_LDOF v33 0 1e-05 Rser=5m
Rbl_LDOF v33 0 1Meg
B_LDOFload v33 0 I=0.5*limit(V(v33)/3,0,1)
.model NMOS NMOS
.model PMOS PMOS
.lib standard.mos
*  ===== 24S PACK -> PDB (avionics tap) -> 8 AWG harness -> ESC DC link; the inverter is its DC-link current (Run 2 has the real one) =====
*  ===== AUX12: 72-100.8 V -> 12 V / 0.5 A synchronous buck, 250 kHz, voltage mode + Type III + input feed-forward =====
*  ===== ESC 12 V loads: bootstrap/gate charge pulses (6 x Qg per PWM period) + driver Iq =====
*  ===== LDOE: 3.3 V LDO (behavioural pass device, Gm = 50 S, dropout 0.25 V, Iq 1 mA) =====
*  ===== HV12: 72-100.8 V -> 12 V / 5 A synchronous buck, 200 kHz, voltage mode + Type III + input feed-forward =====
*  ===== Avionics 12 V load: video / telemetry transmitter, switched on at Tvtx (10 uF input capacitor on its board) =====
*  ===== BEC5: 11-12.6 V -> 5 V / 3 A synchronous buck, 500 kHz, voltage mode + Type III + input feed-forward =====
*  ===== Avionics 5 V loads: flight controller + receiver (0.8 A idle, +1.0 A at Tfc) =====
*  ===== LDOF: 3.3 V LDO (behavioural pass device, Gm = 50 S, dropout 0.25 V, Iq 1 mA) =====
*  === 09  RUN 1: SWITCHING POWER TREE of one 24S channel. AUX12 in the ESC, HV12 -> BEC5 -> LDO for the avionics ===
.param Thov=2.0m Tvtx=2.6m Tfc=3.0m Tw1=3.3m Tw2=3.7m Tpunch=3.8m Trel=4.6m Tss=0.8m Tss5=0.5m
.step param Vpk list 88.8 72 100.8
.model HV_TOP VDMOS(Rd=0.04 Rs=0.005 Vto=3 Kp=15 Cgdmax=2e-10 Cgdmin=3e-12 Cgs=6.5e-10 Cjo=2.5e-10 Vj=1 M=0.5 Is=2e-12 N=1.05 Rb=0.06 Tt=20n Vds=150 Qg=9e-09 mfg=Learning)
.model HV_BOT VDMOS(Rd=0.028 Rs=0.004 Vto=3 Kp=20 Cgdmax=2.5e-10 Cgdmin=4e-12 Cgs=8.5e-10 Cjo=3.3e-10 Vj=1 M=0.5 Is=2e-12 N=1.05 Rb=0.04 Tt=20n Vds=150 Qg=1.1e-08 mfg=Learning)
.model BUCK_FET VDMOS(Rd=0.003 Rs=0.001 Vto=1.6 Kp=60 Cgdmax=4e-10 Cgdmin=6e-11 Cgs=9e-10 Cjo=5e-10 Vj=1 M=0.5 Is=2e-12 N=1.05 Rb=0.006 Tt=10n Vds=30 Qg=1e-08 mfg=Learning)
.tran 0 5.0m 0
.save V(vpk) V(pdb) V(bus) V(idc) V(v12e) V(v33e) V(v12a) V(v5) V(v33) V(pg12) V(ss5) V(HV12sw) V(AUX12sw) V(BEC5sw) V(HV12comp) V(AUX12comp) V(BEC5comp) I(L_HV12) I(L_AUX12) I(L_BEC5) I(Rs_HV12) I(Rs_AUX12) I(Rs_BEC5) I(Lh) I(Rpk) V(HV12in) V(AUX12in) V(BEC5in)
.meas TRAN T_aux WHEN V(v12e)=10.8 RISE=1
.meas TRAN T_hv WHEN V(v12a)=10.8 RISE=1
.meas TRAN T_5 WHEN V(v5)=4.5 RISE=1
.meas TRAN T_33 WHEN V(v33)=3.0 RISE=1
.meas TRAN T_33e WHEN V(v33e)=3.0 RISE=1
.meas TRAN V12e AVG V(v12e) FROM {Tw1} TO {Tw2}
.meas TRAN V12a AVG V(v12a) FROM {Tw1} TO {Tw2}
.meas TRAN V5 AVG V(v5) FROM {Tw1} TO {Tw2}
.meas TRAN V33 AVG V(v33) FROM {Tw1} TO {Tw2}
.meas TRAN V33e AVG V(v33e) FROM {Tw1} TO {Tw2}
.meas TRAN Vbus AVG V(bus) FROM {Tw1} TO {Tw2}
.meas TRAN Vpdb AVG V(pdb) FROM {Tw1} TO {Tw2}
.meas TRAN Rip_bus PP V(bus) FROM {Tw1} TO {Tw2}
.meas TRAN Rip_pdb PP V(pdb) FROM {Tw1} TO {Tw2}
.meas TRAN Rip12e PP V(v12e) FROM {Tw1} TO {Tw2}
.meas TRAN Rip12a PP V(v12a) FROM {Tw1} TO {Tw2}
.meas TRAN Rip5 PP V(v5) FROM {Tw1} TO {Tw2}
.meas TRAN Rip33 PP V(v33) FROM {Tw1} TO {Tw2}
.meas TRAN ILpp_hv PP I(L_HV12) FROM {Tw1} TO {Tw2}
.meas TRAN ILpp_aux PP I(L_AUX12) FROM {Tw1} TO {Tw2}
.meas TRAN ILpp_5 PP I(L_BEC5) FROM {Tw1} TO {Tw2}
.meas TRAN Pin_hv AVG V(HV12in)*I(Rs_HV12) FROM {Tw1} TO {Tw2}
.meas TRAN Pout_hv AVG V(v12a)*I(L_HV12) FROM {Tw1} TO {Tw2}
.meas TRAN Pin_aux AVG V(AUX12in)*I(Rs_AUX12) FROM {Tw1} TO {Tw2}
.meas TRAN Pout_aux AVG V(v12e)*I(L_AUX12) FROM {Tw1} TO {Tw2}
.meas TRAN Pin_5 AVG V(BEC5in)*I(Rs_BEC5) FROM {Tw1} TO {Tw2}
.meas TRAN Pout_5 AVG V(v5)*I(L_BEC5) FROM {Tw1} TO {Tw2}
.meas TRAN Eff_hv PARAM Pout_hv/Pin_hv
.meas TRAN Eff_aux PARAM Pout_aux/Pin_aux
.meas TRAN Eff_5 PARAM Pout_5/Pin_5
.meas TRAN Ipk AVG I(Rpk) FROM {Tw1} TO {Tw2}
.meas TRAN Pav_pdb AVG V(pdb)*I(Rs_HV12) FROM {Tw1} TO {Tw2}
.meas TRAN Dip_vtx MIN V(v12a) FROM {Tvtx} TO {Tvtx+0.25m}
.meas TRAN V12a_pre AVG V(v12a) FROM {Tvtx-0.1m} TO {Tvtx}
.meas TRAN Dip_fc MIN V(v5) FROM {Tfc} TO {Tfc+0.2m}
.meas TRAN V5_pre AVG V(v5) FROM {Tfc-0.1m} TO {Tfc}
.meas TRAN Vbus_punch MIN V(bus) FROM {Tpunch} TO {Trel}
.meas TRAN Vpdb_punch MIN V(pdb) FROM {Tpunch} TO {Trel}
.meas TRAN Vbus_pk_rel MAX V(bus) FROM {Trel} TO {Trel+0.3m}
.meas TRAN V12a_dev_punch PP V(v12a) FROM {Tpunch} TO {Trel+0.3m}
.meas TRAN V12e_dev_punch PP V(v12e) FROM {Tpunch} TO {Trel+0.3m}
.meas TRAN V5_dev_punch PP V(v5) FROM {Tpunch} TO {Trel+0.3m}
.meas TRAN V12e_min_gate MIN V(v12e) FROM {Thov+0.5m} TO {Tvtx}
.backanno
.end